# Altium schematic sheet SmartIrrigation-IoT.SchDoc
size A4; SheetNumber: 1; SheetTotal: 1
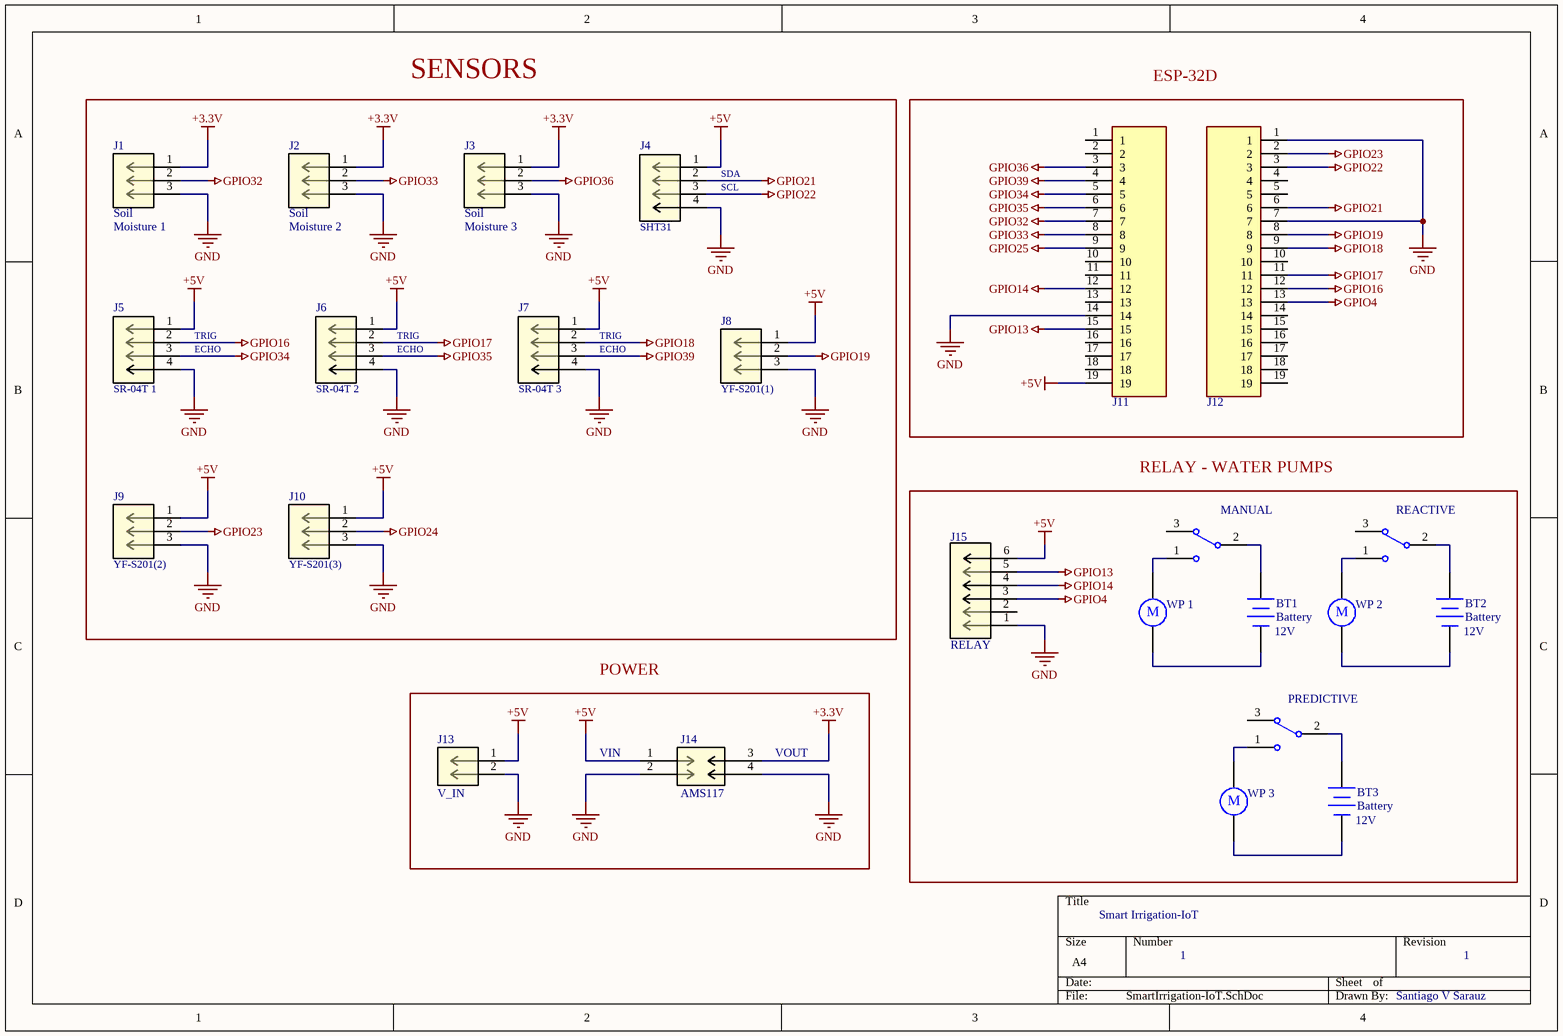
[diagram p0: SmartIrrigation-IoT.SchDoc]

## Parts
2S?  SW-SPDT  [TL36WW15050]  (value not drawn)
B1  WP 1  [RB5-10.5]
B2  WP 2  [RB5-10.5]
B3  WP 3  [RB5-10.5]
BT1  Battery  Voltage: 12V  [BAT-2]
BT2  Battery  Voltage: 12V  [BAT-2]
BT3  Battery  Voltage: 12V  [BAT-2]
J1  B3B-XH-A  [JST_B3B-XH-A]  (value not drawn)
J2  B3B-XH-A  [JST_B3B-XH-A]  (value not drawn)
J3  B3B-XH-A  [JST_B3B-XH-A]  (value not drawn)
J4  B4B-XH-A  [JST_B4B-XH-A(LF)(SN)]  (value not drawn)
J5  B4B-XH-A  [JST_B4B-XH-A(LF)(SN)]  (value not drawn)
J6  B4B-XH-A  [JST_B4B-XH-A(LF)(SN)]  (value not drawn)
J7  B4B-XH-A  [JST_B4B-XH-A(LF)(SN)]  (value not drawn)
J8  B3B-XH-A  [JST_B3B-XH-A]  (value not drawn)
J9  B3B-XH-A  [JST_B3B-XH-A]  (value not drawn)
J10  B3B-XH-A  [JST_B3B-XH-A]  (value not drawn)
J11  SSK02-FPH-254-A19  [RHDR19W69P0X254_1X19_4876X250X870P]  (value not drawn)
J12  SSK02-FPH-254-A19  [RHDR19W69P0X254_1X19_4876X250X870P]  (value not drawn)
J13  B2B-XH-A  [JST_B2B-XH-A]  (value not drawn)
J14  AMS117
J15  B6  (value not drawn)
S3  SW-SPDT  [TL36WW15050]  (value not drawn)
S?  SW-SPDT  [TL36WW15050]  (value not drawn)

## Blocks framed on the sheet
SENSORS: J1-J10
ESP-32D: J11 J12
RELAY - WATER PUMPS: 2S? B1-B3 BT1-BT3 J15 S3 S?
POWER: J13 J14

## Nets
+3.3V: J1.1 J2.1 J3.1 J14.3
+5V: J4.1 J5.1 J6.1 J7.1 J8.1 J9.1 J10.1 J11.19 J13.1 J14.1 J15.6
GND: J1.3 J2.3 J3.3 J4.4 J5.4 J6.4 J7.4 J8.3 J9.3 J10.3 J11.14 J12.1 J12.7 J13.2 J14.2 J14.4 J15.1
GPIO4: J12.13 J15.3
GPIO13: J11.15 J15.5
GPIO14: J11.12 J15.4
GPIO16: J5.2 J12.12
GPIO17: J6.2 J12.11
GPIO18: J7.2 J12.9
GPIO19: J8.2 J12.8
GPIO21: J4.2 J12.6
GPIO22: J4.3 J12.3
GPIO23: J9.2 J12.2
GPIO24: J10.2
GPIO25: J11.9
GPIO32: J1.2 J11.7
GPIO33: J2.2 J11.8
GPIO34: J5.3 J11.5
GPIO35: J6.3 J11.6
GPIO36: J3.2 J11.3
GPIO39: J7.3 J11.4
Net2S?_1: 2S?.1 B2.1
Net2S?_2: 2S?.2 BT2.1(+)
NetB1_1: B1.1 S?.1
NetB1_2: B1.2 BT1.2(-)
NetB2_2: B2.2 BT2.2(-)
NetB3_1: B3.1 S3.1
NetB3_2: B3.2 BT3.2(-)
NetBT1_1: BT1.1(+) S?.2
NetBT3_1: BT3.1(+) S3.2

Not connected (* = marked no-connect by the designer): 2S? 3; J11 1 2 10 11 13 16 17 18; J12 4 5 10 14 15 16 17 18 19; J15 2; S3 3; S? 3

## Notes on the sheet
- (near J4) SDA
- (near J1) Soil
- (near J1) Moisture 1
- (near J2) Soil
- (near J2) Moisture 2
- (near J3) Soil
- (near J3) Moisture 3
- (near J4) SHT31
- (near J4) SCL
- (near J5) TRIG
- (near J5) ECHO
- (near J6) TRIG
- (near J6) ECHO
- (near J7) TRIG
- (near J7) ECHO
- (near J5) SR-04T 1
- (near J6) SR-04T 2
- (near J7) SR-04T 3
- (near J8) YF-S201(1)
- (near S?) MANUAL
- (near 2S?) REACTIVE
- (near J9) YF-S201(2)
- (near J10) YF-S201(3)
- (near J15) RELAY
- (near S3) PREDICTIVE
- (near J14) VIN
- (near J14) VOUT
- (near J13) V_IN
- Smart Irrigation-IoT
- 1
- Santiago V Sarauz
- (in symbol Motor) M

## Library data of the parts
2S? S3 S? = SW-SPDT: SPDT Subminiature Toggle Switch, Right Angle Mounting, Vertical Actuation; Published: 24-Mar-1999; LatestRevisionDate: 17-Dec-2003; LatestRevisionNote: Schematic revised, PCB Footprint replaced.; DatasheetVersion: 05-Dec-2000; PackageReference: TL36WW15050; Publisher: Altium Limited; PackageDescription: Switch; 4 Leads; ComponentLink1Description: Manufacturer Link; ComponentLink1URL: http://www.apem.com
B1-B3 = Motor: Motor, General Kind; Published: 24-Mar-1999; LatestRevisionDate: 17-Jul-2002; LatestRevisionNote: Re-released for DXP Platform.; PackageReference: RB5-10.5; Publisher: Altium Limited; PackageDescription: Capacitor (Radial); 2 Leads
BT1-BT3 = Battery: Multicell Battery; Published: 24-Mar-1999; LatestRevisionDate: 17-Jul-2002; LatestRevisionNote: Re-released for DXP Platform.; PackageReference: BAT-2; Publisher: Altium Limited; PackageDescription: Battery; 2 Leads
J1-J3 J8-J10 = B3B-XH-A: Description; Manufacturer_Name: JST; Copyright: Copyright (C) 2026 Ultra Librarian. All rights reserved.; Manufacturer_Part_Number: B3B-XH-A; RefDes: RefDes; Type: Type
J4-J7 = B4B-XH-A: Description; Manufacturer_Name: JST; Copyright: Copyright (C) 2026 Ultra Librarian. All rights reserved.; Manufacturer_Part_Number: B4B-XH-A; RefDes: RefDes; Type: Type
J11 J12 = FPH-1X19: 2.54 mm Female Header, 1 x 19 Pin, Straight, PA6T, Gold Flash, Rectangular Connector; Manufacturer_Name: Same Sky; Geometry.Height: 8.7mm; Mouser Part Number: *; Mouser Price/Stock: *; Manufacturer_Part_Number: SSK02-FPH-254-A19; Datasheet Link: https://www.sameskydevices.com/product/resource/ssk02-fph-254.pdf
J13 = B2B-XH-A: Description; Manufacturer_Name: JST; Copyright: Copyright (C) 2026 Ultra Librarian. All rights reserved.; Manufacturer_Part_Number: B2B-XH-A; RefDes: RefDes; Type: Type
J14 = AMS117: Description; Copyright: Copyright (C) 2026 Ultra Librarian. All rights reserved.; Type: Type
J15 = B6: Description; Manufacturer_Name: JST; Manufacturer_Part_Number: B4B-XH-A; Copyright: Copyright (C) 2026 Ultra Librarian. All rights reserved.; RefDes: RefDes; Type: Type